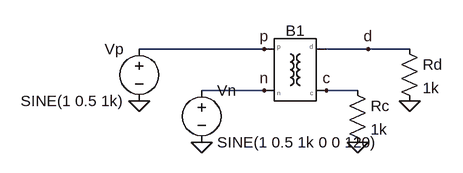
[diagram p0: schematic balun.asc]
balun.asc, the LTspice schematic file:
Version 4
SHEET 1 800 400
WIRE 0 112 192 112
WIRE 96 176 192 176
WIRE 288 112 352 112
WIRE 352 112 416 112
WIRE 288 176 336 176
FLAG 0 192 0
FLAG 96 256 0
FLAG 192 112 p
FLAG 192 176 n
FLAG 352 112 d
FLAG 288 176 c
FLAG 416 192 0
FLAG 336 256 0
SYMBOL voltage 0 96 M0
WINDOW 0 24 16 Left 2
WINDOW 3 24 96 Left 2
SYMATTR InstName Vp
SYMATTR Value SINE(1 0.5 1k)
SYMBOL voltage 96 160 R0
WINDOW 0 24 16 Left 2
WINDOW 3 24 96 Left 2
SYMATTR InstName Vn
SYMATTR Value SINE(1 0.5 1k 0 0 120)
SYMBOL Stability\\Balun 240 144 R0
SYMATTR InstName B1
SYMBOL res 320 160 R0
SYMATTR InstName Rc
SYMATTR Value 1k
SYMBOL res 400 96 R0
SYMATTR InstName Rd
SYMATTR Value 1k

The netlist it stands for:
* balun.asc
Vp p 0 SINE(1 0.5 1k)
Vn n 0 SINE(1 0.5 1k 0 0 120)
XB1 p n d c Balun  ; pins p n d c
Rc c 0 1k
Rd d 0 1k
.lib Stability/LoopProbe.lib
.backanno
.end